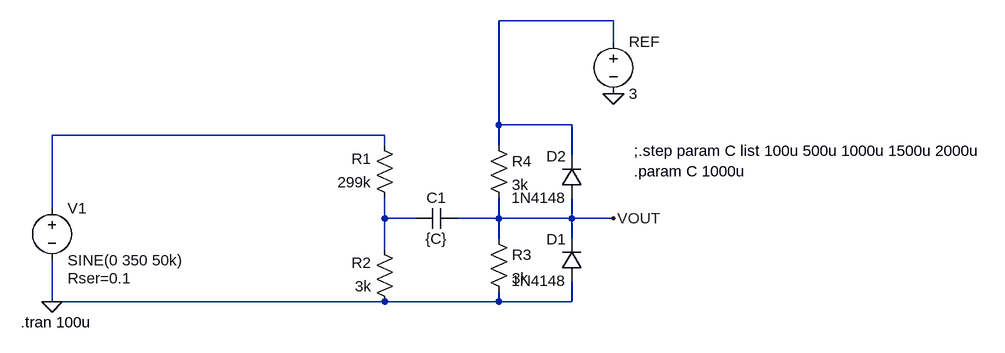
[diagram p0: schematic mains_measure_voltage.asc]
mains_measure_voltage.asc, the LTspice schematic file:
Version 4
SHEET 1 1428 680
WIRE 832 -144 656 -144
WIRE 832 -112 832 -144
WIRE 656 16 656 -144
WIRE 768 16 656 16
WIRE 480 32 -32 32
WIRE 480 48 480 32
WIRE 656 48 656 16
WIRE 768 64 768 16
WIRE -32 144 -32 32
WIRE 480 160 480 128
WIRE 528 160 480 160
WIRE 656 160 656 128
WIRE 656 160 592 160
WIRE 768 160 768 128
WIRE 768 160 656 160
WIRE 832 160 768 160
WIRE 656 192 656 160
WIRE 768 192 768 160
WIRE 480 208 480 160
WIRE -32 288 -32 224
WIRE 480 288 -32 288
WIRE 656 288 656 272
WIRE 656 288 480 288
WIRE 768 288 768 256
WIRE 768 288 656 288
FLAG -32 288 0
FLAG 832 -32 0
FLAG 832 160 VOUT
SYMBOL voltage -32 128 R0
WINDOW 123 0 0 Left 0
WINDOW 39 24 124 Left 2
SYMATTR SpiceLine Rser=0.1
SYMATTR InstName V1
SYMATTR Value SINE(0 350 50k)
SYMBOL cap 592 144 R90
WINDOW 0 0 32 VBottom 2
WINDOW 3 32 32 VTop 2
SYMATTR InstName C1
SYMATTR Value {C}
SYMBOL res 496 144 R180
WINDOW 0 36 76 Left 2
WINDOW 3 36 40 Left 2
SYMATTR InstName R1
SYMATTR Value 299k
SYMBOL res 496 304 R180
WINDOW 0 36 76 Left 2
WINDOW 3 36 40 Left 2
SYMATTR InstName R2
SYMATTR Value 3k
SYMBOL voltage 832 -128 R0
WINDOW 123 0 0 Left 0
WINDOW 39 0 0 Left 0
SYMATTR InstName REF
SYMATTR Value 3
SYMBOL res 640 176 R0
SYMATTR InstName R3
SYMATTR Value 3k
SYMBOL res 640 32 R0
SYMATTR InstName R4
SYMATTR Value 3k
SYMBOL diode 784 256 R180
WINDOW 0 24 64 Left 2
WINDOW 3 24 0 Left 2
SYMATTR InstName D1
SYMATTR Value 1N4148
SYMBOL diode 784 128 R180
WINDOW 0 24 64 Left 2
WINDOW 3 24 0 Left 2
SYMATTR InstName D2
SYMATTR Value 1N4148
TEXT -80 320 Left 2 !.tran 100u
TEXT 864 56 Left 2 !;.step param C list 100u 500u 1000u 1500u 2000u\n.param C 1000u

The netlist it stands for:
* mains_measure_voltage.asc
V1 N002 0 SINE(0 350 50k) Rser=0.1
C1 VOUT N003 {C}
R1 N003 N002 299k
R2 0 N003 3k
V§REF N001 0 3
R3 VOUT 0 3k
R4 N001 VOUT 3k
D1 0 VOUT 1N4148
D2 VOUT N001 1N4148
.model D D
.lib standard.dio
.tran 100u
;.step param C list 100u 500u 1000u 1500u 2000u
.param C 1000u
.backanno
.end